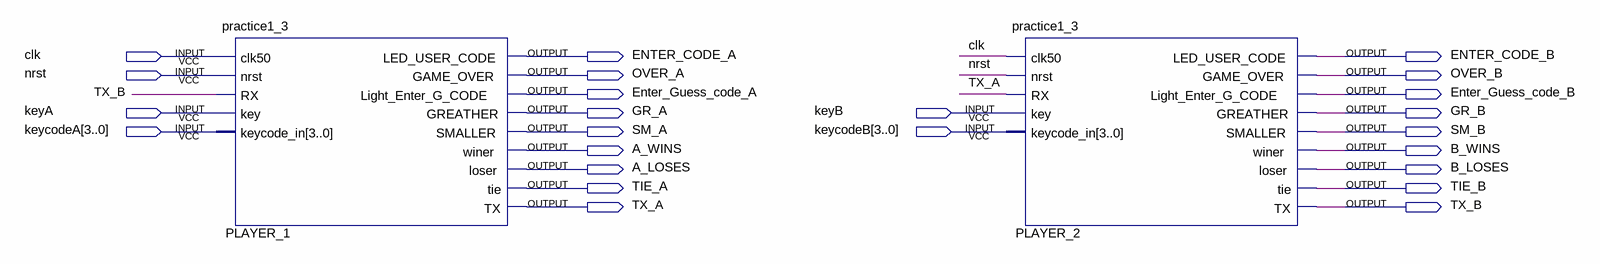
[diagram p0: schematic sheet]
// Quartus schematic .bdf as structural Verilog: 2 symbols, 24 pins
module \  (
  input  clk,
  input  nrst,
  input  keyA,
  input  keyB,
  input  [3:0] keycodeA,
  input  [3:0] keycodeB,
  output ENTER_CODE_A,
  output ENTER_CODE_B,
  output OVER_A,
  output OVER_B,
  output Enter_Guess_code_A,
  output Enter_Guess_code_B,
  output GR_A,
  output GR_B,
  output SM_A,
  output SM_B,
  output A_WINS,
  output B_WINS,
  output A_LOSES,
  output B_LOSES,
  output TIE_A,
  output TIE_B,
  output TX_A,
  output TX_B
);

  practice1_3 PLAYER_1 (
    .clk50(clk), .nrst(nrst), .RX(TX_B), .key(keyA), .keycode_in(keycodeA), .LED_USER_CODE(ENTER_CODE_A),
    .GAME_OVER(OVER_A), .Light_Enter_G_CODE(Enter_Guess_code_A), .GREATHER(GR_A), .SMALLER(SM_A),
    .winer(A_WINS), .loser(A_LOSES), .tie(TIE_A), .TX(TX_A));
  practice1_3 PLAYER_2 (
    .clk50(clk), .nrst(nrst), .RX(TX_A), .key(keyB), .keycode_in(keycodeB), .LED_USER_CODE(ENTER_CODE_B),
    .GAME_OVER(OVER_B), .Light_Enter_G_CODE(Enter_Guess_code_B), .GREATHER(GR_B), .SMALLER(SM_B),
    .winer(B_WINS), .loser(B_LOSES), .tie(TIE_B), .TX(TX_B));
endmodule
